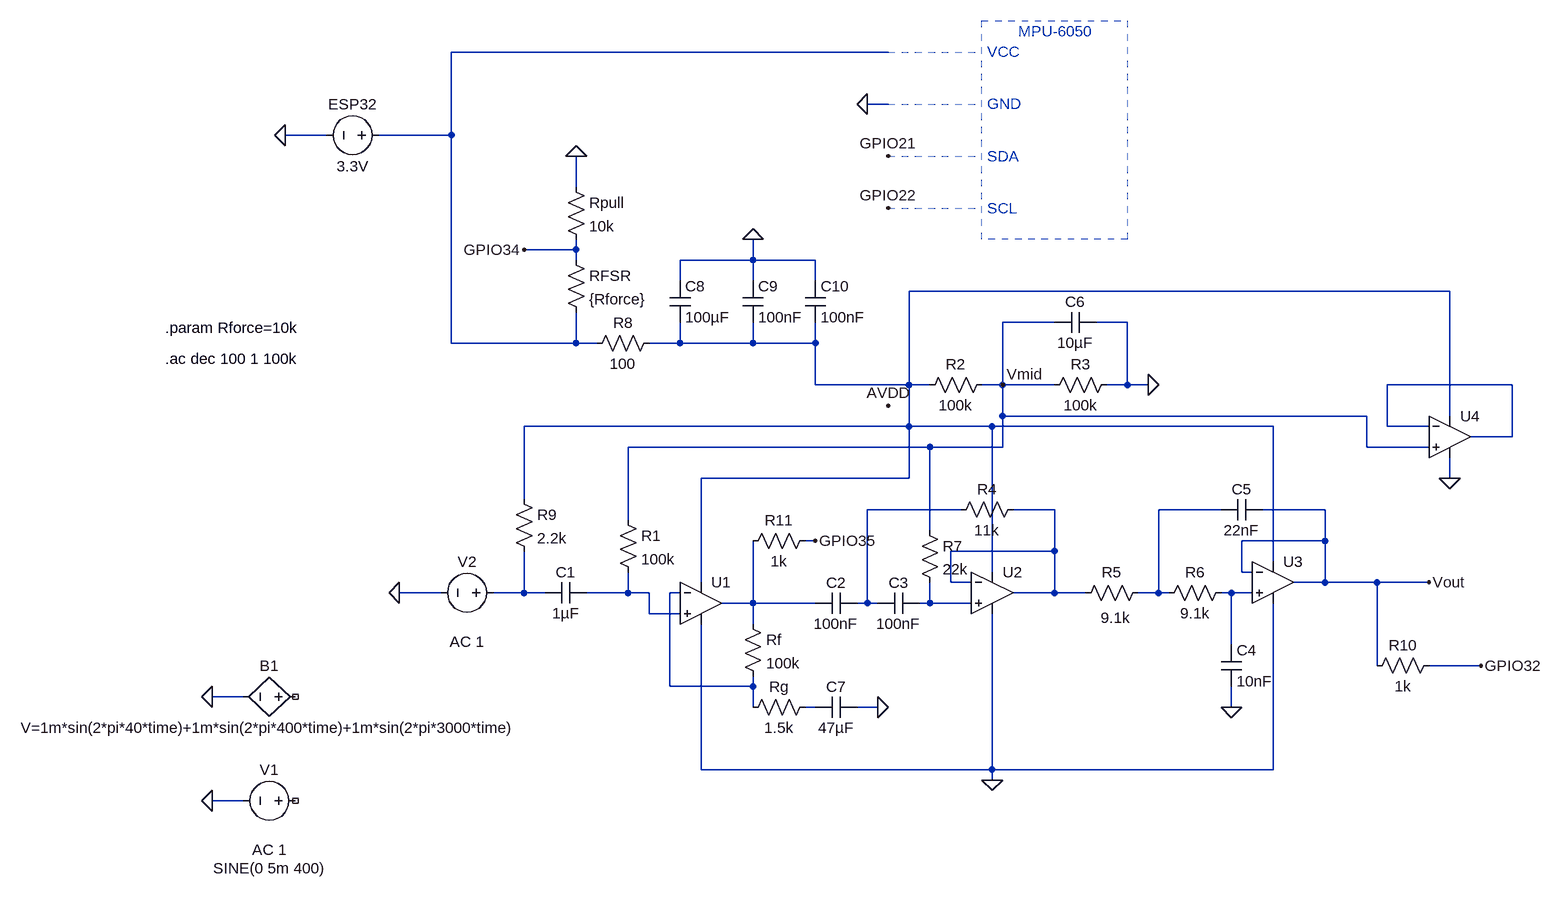
[diagram p0: schematic AUSCULT_AI_Filter - Updated Practical Circuit.asc]
AUSCULT_AI_Filter - Updated Practical Circuit.asc, the LTspice schematic file:
Version 4.1
SHEET 1 1796 680
WIRE 320 -688 -352 -688
WIRE 320 -608 288 -608
WIRE -544 -560 -608 -560
WIRE -352 -560 -352 -688
WIRE -352 -560 -464 -560
WIRE -160 -480 -160 -528
WIRE -160 -384 -160 -400
WIRE -160 -384 -240 -384
WIRE -160 -368 -160 -384
WIRE 112 -368 112 -400
WIRE 112 -368 0 -368
WIRE 208 -368 112 -368
WIRE 0 -336 0 -368
WIRE 112 -336 112 -368
WIRE 208 -336 208 -368
WIRE 1184 -320 352 -320
WIRE 576 -272 496 -272
WIRE 688 -272 640 -272
WIRE -352 -240 -352 -560
WIRE -160 -240 -160 -288
WIRE -160 -240 -352 -240
WIRE -128 -240 -160 -240
WIRE 0 -240 0 -272
WIRE 0 -240 -48 -240
WIRE 112 -240 112 -272
WIRE 112 -240 0 -240
WIRE 208 -240 208 -272
WIRE 208 -240 112 -240
WIRE 208 -176 208 -240
WIRE 352 -176 352 -320
WIRE 352 -176 208 -176
WIRE 384 -176 352 -176
WIRE 496 -176 496 -272
WIRE 496 -176 464 -176
WIRE 576 -176 496 -176
WIRE 688 -176 688 -272
WIRE 688 -176 656 -176
WIRE 720 -176 688 -176
WIRE 1280 -176 1088 -176
WIRE 496 -128 496 -176
WIRE 1056 -128 496 -128
WIRE 1184 -128 1184 -320
WIRE 352 -112 352 -176
WIRE 352 -112 -240 -112
WIRE 480 -112 352 -112
WIRE 912 -112 480 -112
WIRE 1088 -112 1088 -176
WIRE 1152 -112 1088 -112
WIRE 1280 -96 1280 -176
WIRE 1280 -96 1216 -96
WIRE 384 -80 -80 -80
WIRE 496 -80 496 -128
WIRE 496 -80 384 -80
WIRE 1056 -80 1056 -128
WIRE 1152 -80 1056 -80
WIRE 352 -32 352 -112
WIRE 352 -32 32 -32
WIRE 1184 -32 1184 -64
WIRE -240 0 -240 -112
WIRE 432 16 288 16
WIRE 576 16 512 16
WIRE 832 16 736 16
WIRE 992 16 896 16
WIRE -80 32 -80 -80
WIRE 384 48 384 -80
WIRE 208 64 192 64
WIRE 992 64 992 16
WIRE 992 64 864 64
WIRE 576 80 576 16
WIRE 576 80 416 80
WIRE 912 96 912 -112
WIRE 480 112 480 -112
WIRE 864 112 864 64
WIRE 880 112 864 112
WIRE 32 128 32 -32
WIRE 416 128 416 80
WIRE 448 128 416 128
WIRE 992 128 992 64
WIRE 992 128 944 128
WIRE 1072 128 992 128
WIRE 1152 128 1072 128
WIRE -368 144 -432 144
WIRE -240 144 -240 80
WIRE -240 144 -288 144
WIRE -208 144 -240 144
WIRE -80 144 -80 112
WIRE -80 144 -144 144
WIRE -48 144 -80 144
WIRE 0 144 -16 144
WIRE 576 144 576 80
WIRE 576 144 512 144
WIRE 624 144 576 144
WIRE 736 144 736 16
WIRE 736 144 704 144
WIRE 752 144 736 144
WIRE 848 144 832 144
WIRE 880 144 848 144
WIRE 112 160 112 64
WIRE 112 160 64 160
WIRE 208 160 112 160
WIRE 288 160 288 16
WIRE 288 160 272 160
WIRE 304 160 288 160
WIRE 384 160 384 128
WIRE 384 160 368 160
WIRE 448 160 384 160
WIRE -48 176 -48 144
WIRE 0 176 -48 176
WIRE 112 192 112 160
WIRE 848 224 848 144
WIRE 1072 256 1072 128
WIRE 1232 256 1152 256
WIRE -16 288 -16 144
WIRE 112 288 112 272
WIRE 112 288 -16 288
WIRE -672 304 -720 304
WIRE 112 320 112 288
WIRE 208 320 192 320
WIRE 304 320 272 320
WIRE 848 320 848 288
WIRE 32 416 32 192
WIRE 480 416 480 176
WIRE 480 416 32 416
WIRE 912 416 912 160
WIRE 912 416 480 416
WIRE 480 432 480 416
WIRE -672 464 -720 464
FLAG 848 320 0
FLAG 1152 128 Vout
FLAG 480 432 0
FLAG 304 320 0
FLAG 496 -176 Vmid
FLAG -608 -560 0
FLAG 1184 -32 0
FLAG 720 -176 0
FLAG 112 -400 0
FLAG 320 -144 AVDD
FLAG 1232 256 GPIO32
FLAG 208 64 GPIO35
FLAG -160 -528 0
FLAG -240 -384 GPIO34
FLAG 320 -528 GPIO21
FLAG 320 -448 GPIO22
FLAG 288 -608 0
FLAG -720 304 0
FLAG -432 144 0
FLAG -720 464 0
SYMBOL OpAmps\\UniversalOpAmp2 32 160 R0
SYMATTR InstName U1
SYMBOL OpAmps\\UniversalOpAmp2 480 144 R0
SYMATTR InstName U2
SYMBOL OpAmps\\UniversalOpAmp2 912 128 R0
SYMATTR InstName U3
SYMBOL cap -144 128 R90
WINDOW 0 0 32 VBottom 2
WINDOW 3 32 32 VTop 2
SYMATTR InstName C1
SYMATTR Value 1µF
SYMBOL res -96 16 R0
SYMATTR InstName R1
SYMATTR Value 100k
SYMBOL res 96 176 R0
SYMATTR InstName Rf
SYMATTR Value 100k
SYMBOL res 96 336 R270
WINDOW 0 32 56 VTop 2
WINDOW 3 0 56 VBottom 2
SYMATTR InstName Rg
SYMATTR Value 1.5k
SYMBOL cap 272 144 R90
WINDOW 0 0 32 VBottom 2
WINDOW 3 32 32 VTop 2
SYMATTR InstName C2
SYMATTR Value 100nF
SYMBOL cap 368 144 R90
WINDOW 0 0 32 VBottom 2
WINDOW 3 32 32 VTop 2
SYMATTR InstName C3
SYMATTR Value 100nF
SYMBOL res 528 0 R90
WINDOW 0 0 56 VBottom 2
WINDOW 3 32 56 VTop 2
SYMATTR InstName R4
SYMATTR Value 11k
SYMBOL res 720 128 R90
WINDOW 0 0 56 VBottom 2
WINDOW 3 39 50 VTop 2
SYMATTR InstName R5
SYMATTR Value 9.1k
SYMBOL res 848 128 R90
WINDOW 0 0 56 VBottom 2
WINDOW 3 32 56 VTop 2
SYMATTR InstName R6
SYMATTR Value 9.1k
SYMBOL cap 832 224 R0
SYMATTR InstName C4
SYMATTR Value 10nF
SYMBOL cap 896 0 R90
WINDOW 0 0 32 VBottom 2
WINDOW 3 32 32 VTop 2
SYMATTR InstName C5
SYMATTR Value 22nF
SYMBOL res 368 32 R0
SYMATTR InstName R7
SYMATTR Value 22k
SYMBOL voltage -448 -560 R90
WINDOW 0 -32 56 VBottom 2
WINDOW 3 32 56 VTop 2
WINDOW 123 0 0 Left 0
WINDOW 39 0 0 Left 0
SYMATTR InstName ESP32
SYMATTR Value 3.3V
SYMBOL res 480 -192 R90
WINDOW 0 0 56 VBottom 2
WINDOW 3 32 56 VTop 2
SYMATTR InstName R2
SYMATTR Value 100k
SYMBOL res 672 -192 R90
WINDOW 0 0 56 VBottom 2
WINDOW 3 32 56 VTop 2
SYMATTR InstName R3
SYMATTR Value 100k
SYMBOL cap 640 -288 R90
WINDOW 0 0 32 VBottom 2
WINDOW 3 32 32 VTop 2
SYMATTR InstName C6
SYMATTR Value 10µF
SYMBOL cap 208 336 R270
WINDOW 0 32 32 VTop 2
WINDOW 3 0 32 VBottom 2
SYMATTR InstName C7
SYMATTR Value 47µF
SYMBOL voltage -576 464 R90
WINDOW 0 -32 56 VBottom 2
WINDOW 3 88 56 VTop 2
WINDOW 123 60 56 VTop 2
WINDOW 39 0 0 Left 0
SYMATTR InstName V1
SYMATTR Value SINE(0 5m 400)
SYMATTR Value2 AC 1
SYMBOL res -32 -256 R90
WINDOW 0 0 56 VBottom 2
WINDOW 3 32 56 VTop 2
SYMATTR InstName R8
SYMATTR Value 100
SYMBOL cap -16 -336 R0
SYMATTR InstName C8
SYMATTR Value 100µF
SYMBOL OpAmps\\UniversalOpAmp2 1184 -96 R0
SYMATTR InstName U4
SYMBOL cap 96 -336 R0
SYMATTR InstName C9
SYMATTR Value 100nF
SYMBOL cap 192 -336 R0
SYMATTR InstName C10
SYMATTR Value 100nF
SYMBOL res -256 -16 R0
SYMATTR InstName R9
SYMATTR Value 2.2k
SYMBOL res 1168 240 R90
WINDOW 0 0 56 VBottom 2
WINDOW 3 32 56 VTop 2
SYMATTR InstName R10
SYMATTR Value 1k
SYMBOL res 208 48 R90
WINDOW 0 0 56 VBottom 2
WINDOW 3 32 56 VTop 2
SYMATTR InstName R11
SYMATTR Value 1k
SYMBOL res -176 -384 R0
SYMATTR InstName RFSR
SYMATTR Value {Rforce}
SYMBOL res -176 -496 R0
SYMATTR InstName Rpull
SYMATTR Value 10k
SYMBOL bv -576 304 R90
WINDOW 0 -32 56 VBottom 2
WINDOW 3 32 56 VTop 2
SYMATTR InstName B1
SYMATTR Value V=1m*sin(2*pi*40*time)+1m*sin(2*pi*400*time)+1m*sin(2*pi*3000*time)
SYMBOL voltage -272 144 R90
WINDOW 0 -32 56 VBottom 2
WINDOW 3 88 56 VTop 2
WINDOW 123 60 56 VTop 2
WINDOW 39 0 0 Left 0
SYMATTR InstName V2
SYMATTR Value ""
SYMATTR Value2 AC 1
TEXT 520 -720 Left 2 ;MPU-6050
TEXT 472 -688 Left 2 ;VCC
TEXT 472 -608 Left 2 ;GND
TEXT 472 -528 Left 2 ;SDA
TEXT 472 -448 Left 2 ;SCL
TEXT -792 -264 Left 2 !.param Rforce=10k
TEXT -792 -216 Left 2 !.ac dec 100 1 100k
LINE Normal 320 -688 464 -688 2
LINE Normal 320 -608 464 -608 2
LINE Normal 320 -528 464 -528 2
LINE Normal 320 -448 464 -448 2
RECTANGLE Normal 688 -400 464 -736 2

The netlist it stands for:
* AUSCULT_AI_Filter - Updated Practical Circuit.asc
X§U1 N008 N009 N002 0 N011 level2 Avol=1Meg GBW=10Meg Slew=10Meg Ilimit=25m Rail=0 Vos=0 En=0 Enk=0 In=0 Ink=0 Rin=500Meg  ; pins In+ In- V+ V- OUT
X§U2 N012 N005 N002 0 N005 level2 Avol=1Meg GBW=10Meg Slew=10Meg Ilimit=25m Rail=0 Vos=0 En=0 Enk=0 In=0 Ink=0 Rin=500Meg  ; pins In+ In- V+ V- OUT
X§U3 N010 Vout N002 0 Vout level2 Avol=1Meg GBW=10Meg Slew=10Meg Ilimit=25m Rail=0 Vos=0 En=0 Enk=0 In=0 Ink=0 Rin=500Meg  ; pins In+ In- V+ V- OUT
C1 N008 N007 1µF
R1 Vmid N008 100k
Rf N011 N009 100k
Rg N009 N013 1.5k
C2 N004 N011 100nF
C3 N012 N004 100nF
R4 N005 N004 11k
R5 N006 N005 9.1k
R6 N010 N006 9.1k
C4 N010 0 10nF
C5 Vout N006 22nF
R7 Vmid N012 22k
V§ESP32 N001 0 3.3V
R2 Vmid N002 100k
R3 0 Vmid 100k
C6 0 Vmid 10µF
C7 N013 0 47µF
V1 NC_01 0 SINE(0 5m 400) AC 1
R8 N002 N001 100
C8 0 N002 100µF
X§U4 Vmid N003 N002 0 N003 level2 Avol=1Meg GBW=10Meg Slew=10Meg Ilimit=25m Rail=0 Vos=0 En=0 Enk=0 In=0 Ink=0 Rin=500Meg  ; pins In+ In- V+ V- OUT
C9 0 N002 100nF
C10 0 N002 100nF
R9 N002 N007 2.2k
R10 GPIO32 Vout 1k
R11 GPIO35 N011 1k
RFSR GPIO34 N001 {Rforce}
Rpull 0 GPIO34 10k
B1 NC_02 0 V=1m*sin(2*pi*40*time)+1m*sin(2*pi*400*time)+1m*sin(2*pi*3000*time)
V2 N007 0 AC 1
* MPU-6050
* VCC
* GND
* SDA
* SCL
.param Rforce=10k
.ac dec 100 1 100k
.lib UniversalOpAmp2.lib
.backanno
.end